# Altium schematic sheet BD.SchDoc: ESP32 - ANALOG BOARD
size A3; Author: Luca Schenetti; DrawnBy: Luca Schenetti; Revision: B; SheetNumber: 2; SheetTotal: 6
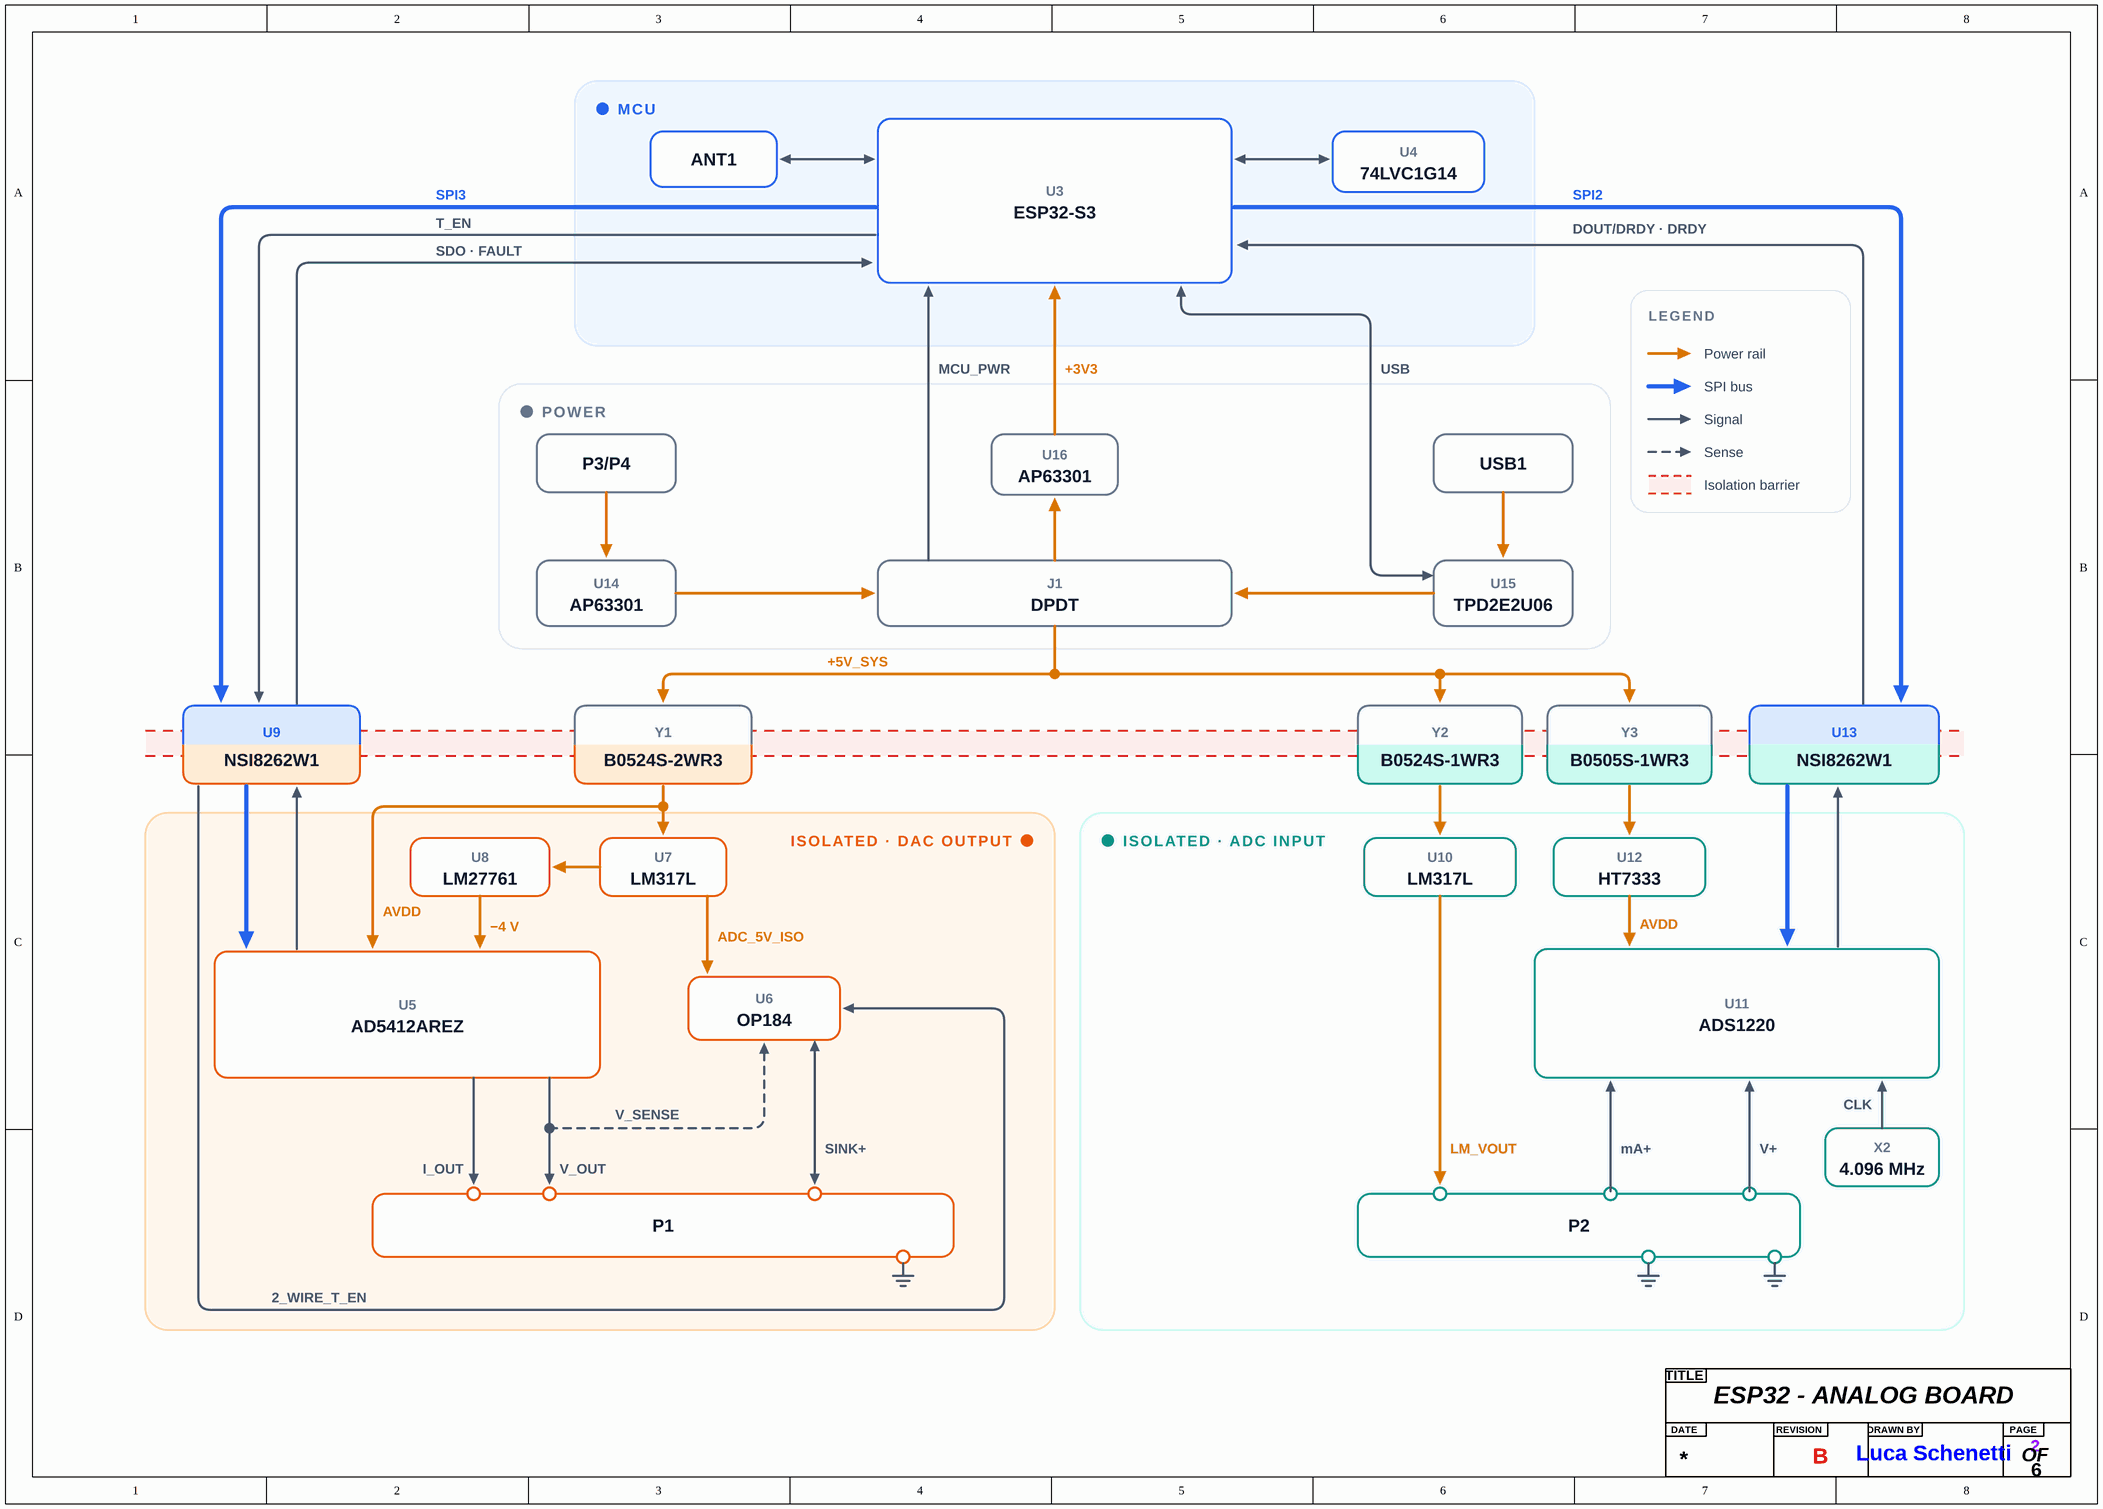
[diagram p0: BD.SchDoc]

## Parts
?  Title  (value not drawn)  (graphical)

## Notes on the sheet
- (in symbol Title) TITLE; DATE; REVISION; DRAWN BY; PAGE; OF